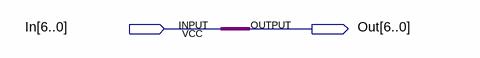
[diagram p0: schematic sheet]
// Quartus schematic 7Buffer.bdf as structural Verilog: 0 symbols, 2 pins
module \7Buffer  (
  input  [6:0] In,
  output [6:0] Out
);


  assign Out = In;
endmodule
